# Altium schematic sheet SD_CARD.SchDoc
size A4; SheetNumber: 4; SheetTotal: 4
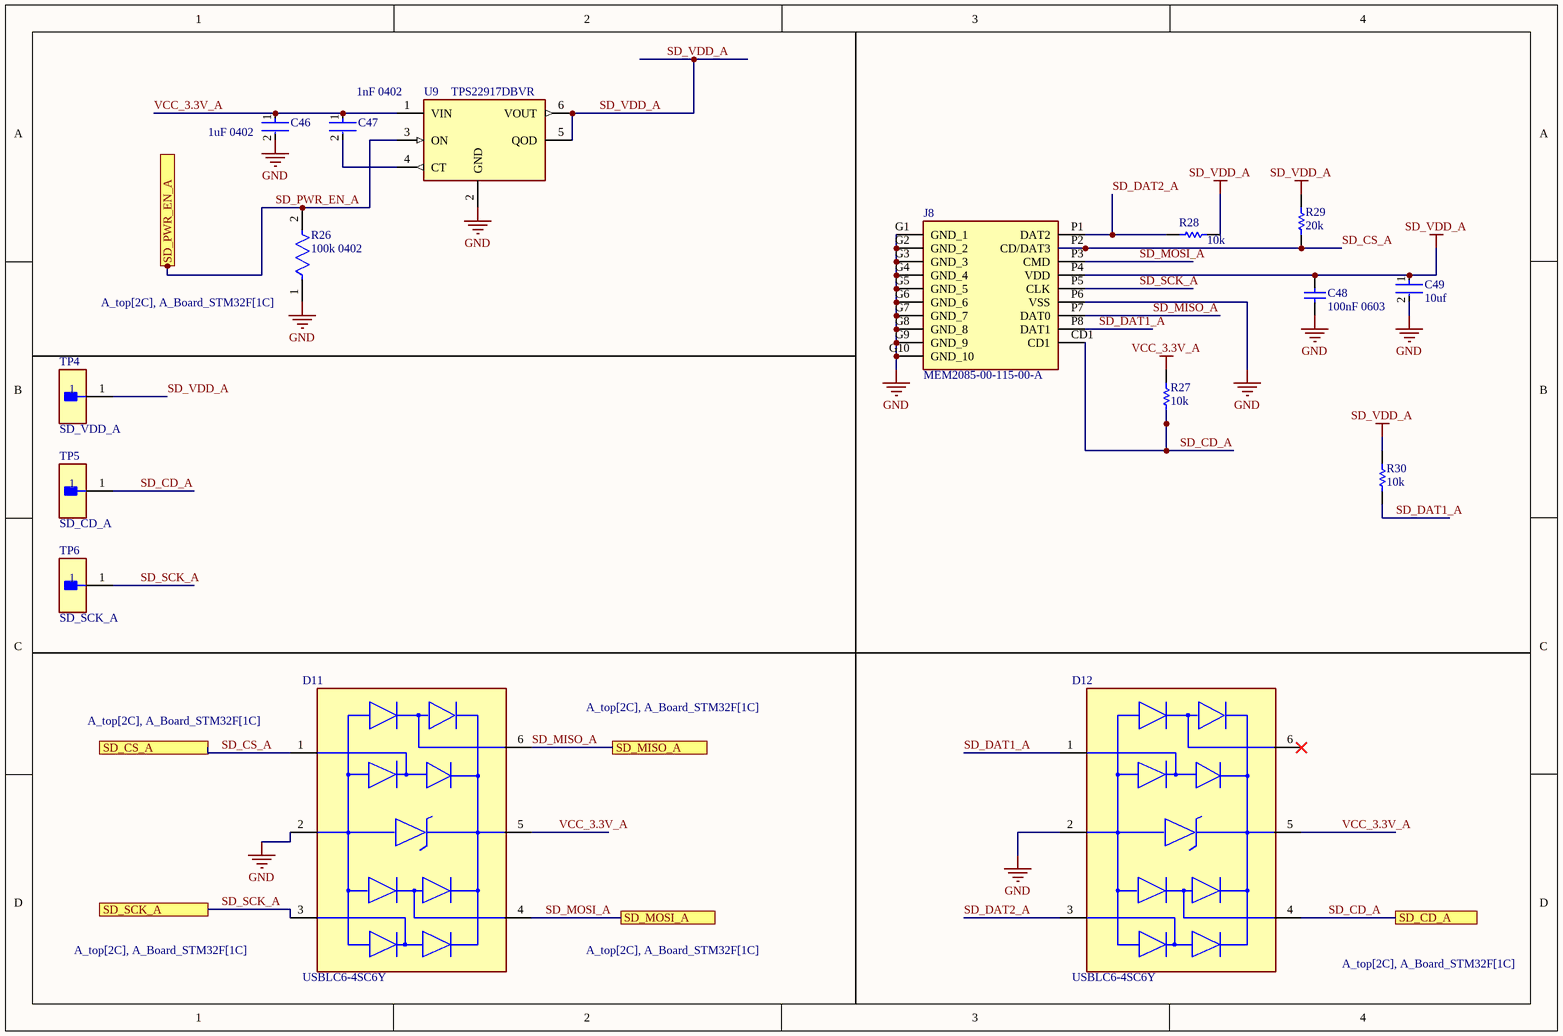
[diagram p0: SD_CARD.SchDoc]

## Parts
C46  1uF 0402  [FP-CL511-IPC_C]
C47  1nF 0402  [FP-C0402-BB-MFG]
C48  100nF 0603  [CAPC1608X90X35NL15T15]
C49  10uf  [FP-CL05A106MP5NUNC-MFG]
D11  USBLC6-4SC6Y  [FP-SOT23-6L-MFG]
D12  USBLC6-4SC6Y  [FP-SOT23-6L-MFG]
J8  MEM2085-00-115-00-A  [MEM20850011500A]
R26  100k 0402  [FP-CRGCQ0402-IPC_C]
R27  10k  [RESC0603X26X15LL03T05]
R28  10k  [RESC0603X26X15LL03T05]
R29  20k  [RESC1005X40X25ML05T05]
R30  10k  [RESC0603X26X15LL03T05]
TP4  SD_VDD_A  [FP-5015-MFG]
TP5  SD_CD_A  [FP-5015-MFG]
TP6  SD_SCK_A  [FP-5015-MFG]
U9  TPS22917DBVR  [FP-DBV0006A-IPC_A]

## Ports
SD_CD_A (see A_top[2C], A_Board_STM32F[1C]), SD_CS_A (see A_top[2C], A_Board_STM32F[1C]), SD_MISO_A (see A_top[2C], A_Board_STM32F[1C]), SD_MOSI_A (see A_top[2C], A_Board_STM32F[1C]), SD_PWR_EN_A (see A_top[2C], A_Board_STM32F[1C]), SD_SCK_A (see A_top[2C], A_Board_STM32F[1C])

## Nets
GND: C46.2 C48.1 C49.2 D11.2(GND) D12.2(GND) J8.G1(GND_1) J8.G2(GND_2) J8.G3(GND_3) J8.G4(GND_4) J8.G5(GND_5) J8.G6(GND_6) J8.G7(GND_7) J8.G8(GND_8) J8.G9(GND_9) J8.G10(GND_10) J8.P6(VSS) R26.1 U9.2(GND)
SD_VDD_A: C48.2 C49.1 J8.P4(VDD) R28.2 R29.2 R30.2 TP4.1 U9.5(QOD) U9.6(VOUT)
VCC_3.3V_A: C46.1 C47.1 D11.5(VBUS) D12.5(VBUS) R27.2 U9.1(VIN)
SD_CD_A: D12.4(I/O3) J8.CD1 R27.1 TP5.1 ; port SD_CD_A
SD_CS_A: D11.1(I/O1) J8.P2(CD/DAT3) R29.1 ; port SD_CS_A
SD_DAT1_A: D12.1(I/O1) J8.P8(DAT1) R30.1
SD_DAT2_A: D12.3(I/O2) J8.P1(DAT2) R28.1
SD_MISO_A: D11.6(I/O4) J8.P7(DAT0) ; port SD_MISO_A
SD_MOSI_A: D11.4(I/O3) J8.P3(CMD) ; port SD_MOSI_A
SD_PWR_EN_A: R26.2 U9.3(ON) ; port SD_PWR_EN_A
SD_SCK_A: D11.3(I/O2) J8.P5(CLK) TP6.1 ; port SD_SCK_A
NetC47_2: C47.2 U9.4(CT)

Not connected (* = marked no-connect by the designer): D12 6(I/O4)*

## Library data of the parts
C46 = CMP-13271-001936-1: Cap Ceramic 1uF 10V X5R ±10% SMD 0402 +85°C Paper T/R; Depth: 0.5mm; Case Code (Imperial): 0402; Material: Ceramic; Mount: Surface Mount; Thickness: 0.022inch; Dielectric: X5R; Capacitance: 1uF; Radiation Hardening: No; Case/Package: 0402; Length: 1mm; Tolerance: 10%; Max Operating Temperature: 85°C; Package Quantity: 1; Width: 0.02inch; Voltage Rating: 10V; Contact Plating: Tin; Height: 0.5mm; Min Operating Temperature: -55°C; Case Code (Metric): 1005; Packaging: Tape and Reel
C47 = CMP-2008-02358-3: C0402 1,000 pF X7R 10.00% 50 V; Manufacturer Part Number: C0402C102K5RAC7411; Manufacturer: Kemet; Voltage Rating: 50 V; Material: Ceramic; Tolerance: 0.1; Temperature Coefficient: 15%; Automotive: No; Temperature Characteristic: X7R; RoHS: TRUE; Category: Cap; Temperature: -55°C to +125°C; Lead Free: Yes; Value: 1,000 pF; Device Class L1: Passive Components; Temperature Range High: +125°C; Octopart: https://octopart.com/c0402c102k5rac7411-kemet-51077941; Capacitance: 1,000 pF; Ipc Land Pattern Name: CAPC10050X50; ComponentLink2URL: https://content.kemet.com/datasheets/KEM_C1002_X7R_SMD.pdf; ComponentLink2Description: Datasheet; Device Class L2: Capacitors; Package: C0402-BB; Device Class L3: Ceramic Capacitors; Mouser Description: Cap Ceramic 0.001uF 50V X7R 10% SMD 0402 125°C Punched Paper T/R; Height: 0.55mm; Temperature Range Low: -55°C
C48 = CMP-2006-02299-1: Part Number: C0603C104K4RAC7013; Manufacturer: Kemet
C49 = CMP-13271-000002-1: CAP CER 10UF 10V X5R 0402; Manufacturer Part Number: CL05A106MP5NUNC; Manufacturer: Samsung; Temperature Coefficient: 15%; Tolerance: 20%; Material: Ceramic; Octopart: https://octopart.com/cl05a106mp5nunc-samsung-22457395; Voltage Rating: 10V; RoHS: TRUE; Value: 10uF; Height: 0.7mm; Digikey Description: CAP CER 10UF 10V X5R 0402; Automotive: No; Package: CL05A106MP5NUNC; Device Class L1: Passive Components; Capacitance: 10uF; Temperature Range High: +85°C; ComponentLink2Description: Datasheet; Device Class L2: Capacitors; Temperature Characteristic: X5R; Temperature: -55°C to +85°C; ComponentLink2URL: http://www.samsungsem.com/kr/support/product-search/mlcc/__icsFiles/afieldfile/2019/05/10/19-CL05A106MP5NUNC.pdf; Device Class L3: Ceramic Capacitors; Category: Cap; Temperature Range Low: -55°C; Ipc Land Pattern Name: CAPC10050X50; Lead Free: Yes
D11 D12 = CMP-12225-000004-1: TVS DIODE 5.25V 17V SOT23-6; Manufacturer: STMicroelectronics; Automotive Grade: Grade 0; Max Junction Temp: +150°C; Number Of Channels: 4; Standoff Height: 0mm; Breakdown Voltage: 6V; Capacitance: 3pF; Value: 3pF; Direction: Unidirectional; Peak Pulse Current: 5A; Device Class L1: Circuit Protection; Device Class L2: TVS Diodes; Octopart: https://octopart.com/usblc6-4sc6y-stmicroelectronics-20614522; ComponentLink2Description: Datasheet; RoHS: TRUE; ComponentLink2URL: https://www.st.com/resource/en/datasheet/usblc6-4sc6y.pdf; Temperature Range Low: -40°C; Package: SOT23-6L; Automotive: Yes; Mouser Description: USBLC6 Series 4 Channel 5.25 V SMT Uni-Directinal Auto ESD Protection - SOT-23-6; Device Class L3: unset; Manufacturer Part Number: USBLC6-4SC6Y; Lead Free: Yes; Temperature Range High: +150°C; Category: Diode; Height: 1.45mm; Clamping Voltage: 17V; Temperature: -40°C to +150°C; Digikey Description: TVS DIODE 5.25V 17V SOT23-6
J8 = MEM2085-00-115-00-A: Connector; Manufacturer_Name: GCT (GLOBAL CONNECTOR TECHNOLOGY); Datasheet Link: https://gct.co/files/drawings/mem2085.pdf; Height: 1.35mm; Manufacturer_Part_Number: MEM2085-00-115-00-A; Mouser Part Number: 640-MEM20850011500A; Mouser Price/Stock: https://www.mouser.co.uk/ProductDetail/GCT/MEM2085-00-115-00-A?qs=rQFj71Wb1eWNkFUhuuvVIA%3D%3D
R26 = CMP-03211-001412-1: CRGCQ0402 100KΩ 1% ±100ppm/°C 50V; Manufacturer Part Number: CRGCQ0402F100K; Manufacturer: TE Connectivity; Tolerance: 0.01; Power Rating: 0.0625W; Resistance: 100KΩ; Ambient Temperature Range High: +70°C; Series: CRGCQ; Temperature: -55°C to +155°C; Temperature Range Low: -55°C; ComponentLink2Description: Datasheet; Category: Res; Temperature Range High: +155°C; Automotive: Yes; Device Class L2: Resistors; Height: 0.4mm; Ipc Land Pattern Name: RESC10050X35; Voltage Rating: 50V; ComponentLink2URL: https://www.te.com/commerce/DocumentDelivery/DDEController?Action=showdoc&DocId=Data+Sheet%7F1773204-3%7F1%7Fpdf%7FEnglish%7FENG_DS_1773204-3_1.pdf%7F4-2176347-1150; Composition: Thick Film; Device Class L1: Passive Components; Device Class L3: Chip SMD Resistors; RoHS: TRUE; Temperature Coefficient: ±100ppm/°C; Lead Free: Yes; Value: 100KΩ; Octopart: https://octopart.com/crgcq0402f100k-te+connectivity-91017930; Package: CRGCQ0402
R27 R28 R30 = CMP-2004-03568-1: Manufacturer: TE Connectivity / AMP; Part Number: CRG0201F10K
R29 = CMP-1011-00105-2: Part Number: CRCW040220K0JNED; Manufacturer: Vishay Dale
TP4-TP6 = CMP-2000-05183-2: PC TEST POINT MINIATURE; Manufacturer Part Number: 5015; Manufacturer: keystone; Number Of Contacts: 1; Conn Orientation: Straight; Category: Conn; Digikey Description: PC TEST POINT MINIATURE; Automotive: No; Lead Free: Yes; Octopart: https://octopart.com/5015-keystone-3822; ComponentLink2URL: http://www.keyelco.com/product-pdf.cfm?p=1353; Package: 5015; RoHS: TRUE; Device Class L3: unset; Device Class L2: unset; Contact Material: Silver; Device Class L1: Connectors; Height: 1.65mm; ComponentLink2Description: Datasheet
U9 = CMP-04912-000029-1: IC PWR SWITCH P-CHAN 1:1 SOT23-6; Number of Outputs: 1; Output Configuration: High Side; Fault Protection: Reverse Current; Interface: On/Off; Max Output Current: 2A; Max Operating Temperature: 125°C; Case/Package: SOT-23-6; Packaging: Tape and Reel; Number of Channels: 1; Min Operating Temperature: -40°C